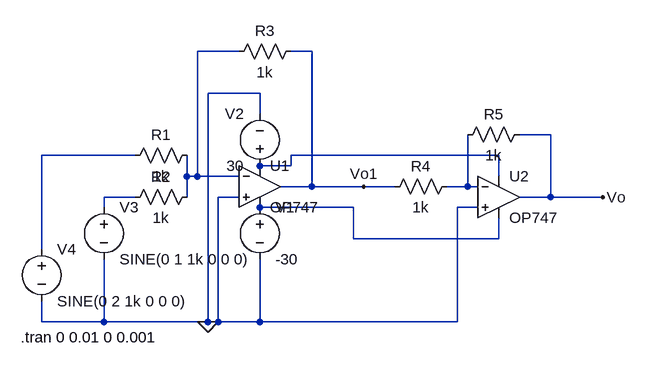
[diagram p0: schematic stage4_summer_and_inverter.asc]
stage4_summer_and_inverter.asc, the LTspice schematic file:
Version 4.1
SHEET 1 880 680
WIRE 128 -64 64 -64
WIRE 240 -64 208 -64
WIRE 160 0 80 0
WIRE 160 32 160 0
WIRE 608 64 560 64
WIRE -32 96 -176 96
WIRE 528 96 208 96
WIRE 208 112 208 96
WIRE 208 112 160 112
WIRE 48 128 48 96
WIRE 64 128 64 -64
WIRE 64 128 48 128
WIRE 128 128 64 128
WIRE 528 128 528 96
WIRE 240 144 240 -64
WIRE 240 144 192 144
WIRE 320 144 240 144
WIRE 368 144 320 144
WIRE 480 144 480 64
WIRE 480 144 448 144
WIRE 496 144 480 144
WIRE -32 160 -80 160
WIRE 48 160 48 128
WIRE 128 160 96 160
WIRE 608 160 608 64
WIRE 608 160 560 160
WIRE 688 160 608 160
WIRE -80 176 -80 160
WIRE 304 176 160 176
WIRE 496 176 464 176
WIRE 304 224 304 176
WIRE 528 224 528 192
WIRE 528 224 304 224
WIRE -176 240 -176 96
WIRE -176 352 -176 320
WIRE -80 352 -80 256
WIRE -80 352 -176 352
WIRE 80 352 80 0
WIRE 80 352 -80 352
WIRE 96 352 96 160
WIRE 96 352 80 352
WIRE 160 352 160 256
WIRE 160 352 96 352
WIRE 464 352 464 176
WIRE 464 352 160 352
FLAG 320 144 Vo1
FLAG 80 352 0
FLAG 688 160 Vo
SYMBOL OpAmps\\OP747 160 80 R0
SYMATTR InstName U1
SYMBOL res 64 80 R90
WINDOW 0 0 56 VBottom 2
WINDOW 3 32 56 VTop 2
SYMATTR InstName R1
SYMATTR Value 1k
SYMBOL res 64 144 R90
WINDOW 0 0 56 VBottom 2
WINDOW 3 32 56 VTop 2
SYMATTR InstName R2
SYMATTR Value 1k
SYMBOL voltage 160 160 R0
SYMATTR InstName V1
SYMATTR Value -30
SYMBOL voltage 160 128 R180
WINDOW 0 24 96 Left 2
WINDOW 3 24 16 Left 2
SYMATTR InstName V2
SYMATTR Value 30
SYMBOL voltage -80 160 R0
WINDOW 123 0 0 Left 0
WINDOW 39 0 0 Left 0
SYMATTR InstName V3
SYMATTR Value SINE(0 1 1k 0 0 0)
SYMBOL voltage -176 224 R0
WINDOW 123 0 0 Left 0
WINDOW 39 0 0 Left 0
SYMATTR InstName V4
SYMATTR Value SINE(0 2 1k 0 0 0)
SYMBOL res 224 -80 R90
WINDOW 0 0 56 VBottom 2
WINDOW 3 32 56 VTop 2
SYMATTR InstName R3
SYMATTR Value 1k
SYMBOL OpAmps\\OP747 528 96 R0
SYMATTR InstName U2
SYMBOL res 464 128 R90
WINDOW 0 0 56 VBottom 2
WINDOW 3 32 56 VTop 2
SYMATTR InstName R4
SYMATTR Value 1k
SYMBOL res 576 48 R90
WINDOW 0 0 56 VBottom 2
WINDOW 3 32 56 VTop 2
SYMATTR InstName R5
SYMATTR Value 1k
TEXT -208 376 Left 2 !.tran 0 0.01 0 0.001

The netlist it stands for:
* stage4_summer_and_inverter.asc
X§U1 0 N001 N003 N006 Vo1 OP747  ; pins In+ In- V+ V- OUT
R1 N001 N002 1k
R2 N001 N005 1k
V1 N006 0 -30
V2 N003 0 30
V3 N005 0 SINE(0 1 1k 0 0 0)
V4 N002 0 SINE(0 2 1k 0 0 0)
R3 Vo1 N001 1k
X§U2 0 N004 N003 N006 Vo OP747  ; pins In+ In- V+ V- OUT
R4 N004 Vo1 1k
R5 Vo N004 1k
.tran 0 0.01 0 0.001
.backanno
.end